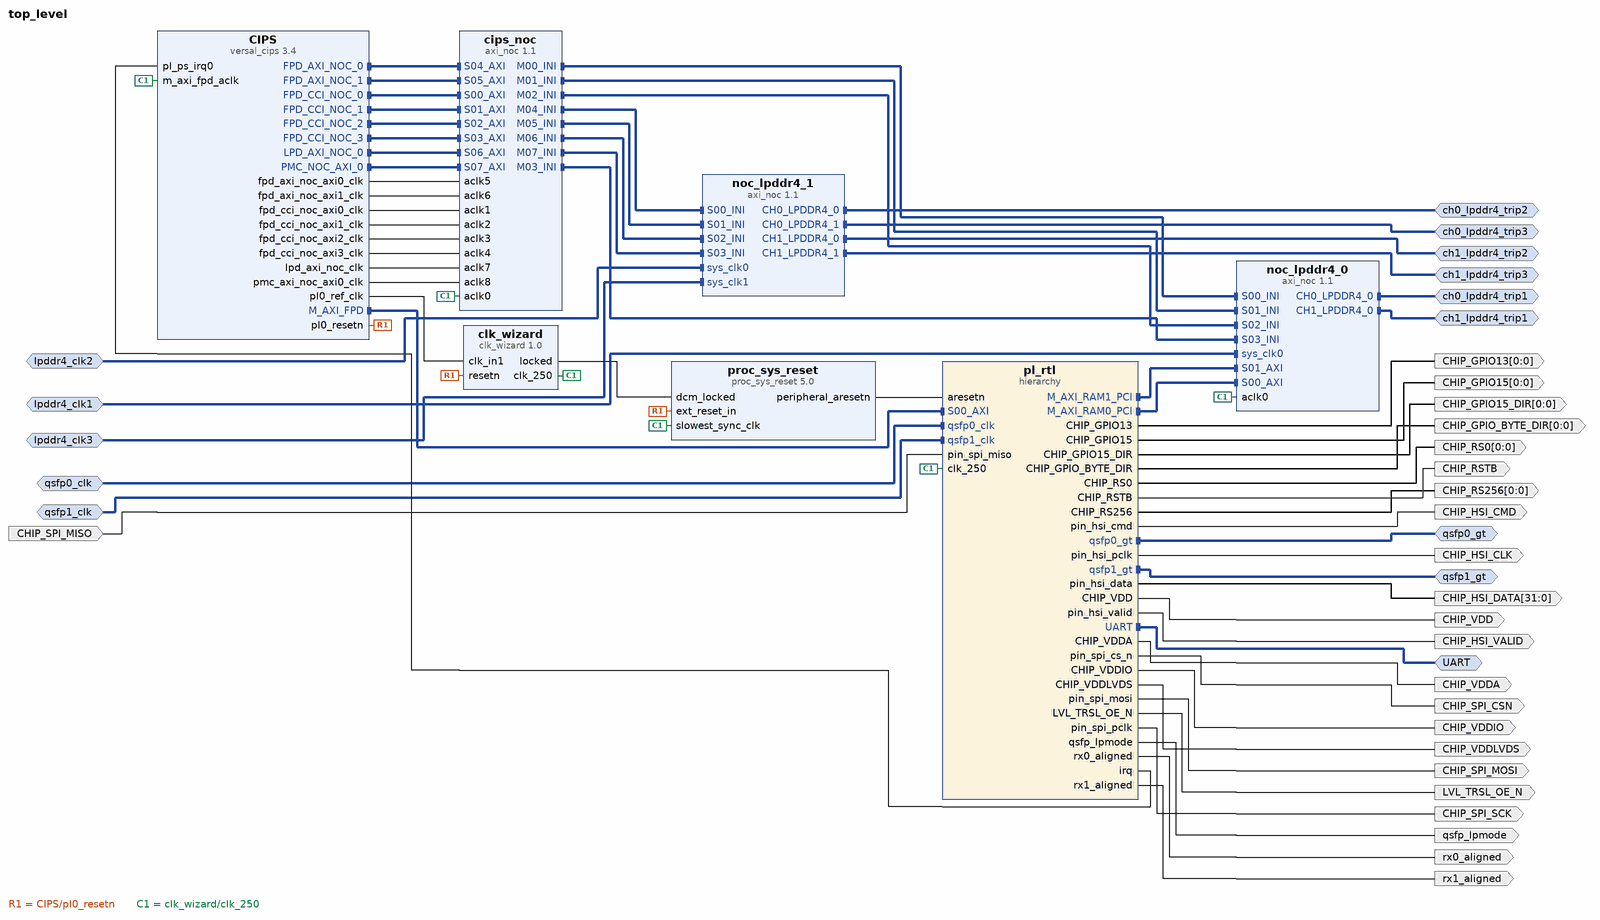
[diagram p0: block diagram of the top level]
# Vivado block design top_level, xcvp1202-vsva2785-2MP-e-S, Vivado 2024.2
create_bd_design top_level

create_bd_intf_port -mode Master -vlnv xilinx.com:interface:lpddr4_rtl:1.0 ch0_lpddr4_trip1
create_bd_intf_port -mode Master -vlnv xilinx.com:interface:lpddr4_rtl:1.0 ch0_lpddr4_trip2
create_bd_intf_port -mode Master -vlnv xilinx.com:interface:lpddr4_rtl:1.0 ch0_lpddr4_trip3
create_bd_intf_port -mode Master -vlnv xilinx.com:interface:lpddr4_rtl:1.0 ch1_lpddr4_trip1
create_bd_intf_port -mode Master -vlnv xilinx.com:interface:lpddr4_rtl:1.0 ch1_lpddr4_trip2
create_bd_intf_port -mode Master -vlnv xilinx.com:interface:lpddr4_rtl:1.0 ch1_lpddr4_trip3
create_bd_intf_port -mode Slave -vlnv xilinx.com:interface:diff_clock_rtl:1.0 lpddr4_clk1
set_property -dict {CONFIG.FREQ_HZ 200321000} [get_bd_intf_ports lpddr4_clk1]
create_bd_intf_port -mode Slave -vlnv xilinx.com:interface:diff_clock_rtl:1.0 lpddr4_clk2
set_property -dict {CONFIG.FREQ_HZ 200321000} [get_bd_intf_ports lpddr4_clk2]
create_bd_intf_port -mode Slave -vlnv xilinx.com:interface:diff_clock_rtl:1.0 lpddr4_clk3
set_property -dict {CONFIG.FREQ_HZ 200321000} [get_bd_intf_ports lpddr4_clk3]
create_bd_intf_port -mode Master -vlnv xilinx.com:interface:uart_rtl:1.0 UART
create_bd_intf_port -mode Slave -vlnv xilinx.com:interface:diff_clock_rtl:1.0 qsfp0_clk
set_property -dict {CONFIG.FREQ_HZ 156250000} [get_bd_intf_ports qsfp0_clk]
create_bd_intf_port -mode Slave -vlnv xilinx.com:interface:diff_clock_rtl:1.0 qsfp1_clk
set_property -dict {CONFIG.FREQ_HZ 156250000} [get_bd_intf_ports qsfp1_clk]
create_bd_intf_port -mode Master -vlnv xilinx.com:interface:gt_rtl:1.0 qsfp0_gt
create_bd_intf_port -mode Master -vlnv xilinx.com:interface:gt_rtl:1.0 qsfp1_gt
create_bd_port -dir O CHIP_SPI_CSN
create_bd_port -dir O CHIP_SPI_MOSI
create_bd_port -dir O CHIP_SPI_SCK
create_bd_port -dir I CHIP_SPI_MISO
create_bd_port -dir O CHIP_RSTB
create_bd_port -dir O LVL_TRSL_OE_N
create_bd_port -dir O CHIP_HSI_CLK
create_bd_port -dir O CHIP_VDDIO
create_bd_port -dir O CHIP_VDDLVDS
create_bd_port -dir O CHIP_VDD
create_bd_port -dir O CHIP_VDDA
create_bd_port -dir O -from 0 -to 0 CHIP_RS0
create_bd_port -dir O -from 0 -to 0 CHIP_RS256
create_bd_port -dir O -from 0 -to 0 CHIP_GPIO_BYTE_DIR
create_bd_port -dir O -from 0 -to 0 CHIP_GPIO15
create_bd_port -dir O -from 0 -to 0 CHIP_GPIO13
create_bd_port -dir O -from 0 -to 0 CHIP_GPIO15_DIR
create_bd_port -dir O CHIP_HSI_CMD
create_bd_port -dir O -from 31 -to 0 CHIP_HSI_DATA
create_bd_port -dir O CHIP_HSI_VALID
create_bd_port -dir O rx0_aligned
create_bd_port -dir O rx1_aligned
create_bd_port -dir O qsfp_lpmode

create_bd_cell -type ip -vlnv xilinx.com:ip:versal_cips:3.4 CIPS
set_property -dict [list \
  CONFIG.CLOCK_MODE Custom \
  CONFIG.DDR_MEMORY_MODE Custom \
  CONFIG.PS_BOARD_INTERFACE ps_pmc_fixed_io \
  CONFIG.PS_PL_CONNECTIVITY_MODE Custom \
  CONFIG.PS_PMC_CONFIG {['CLOCK_MODE Custom', 'DDR_MEMORY_MODE Custom', 'DESIGN_MODE 1', 'DEVICE_INTEGRITY_MODE {Sysmon temperature voltage and external IO monitoring}', 'PMC_CRP_PL0_REF_CTRL_FREQMHZ 99.999992', 'PMC_GPIO0_MIO_PERIPHERAL {{ENABLE 1} {IO {PMC_MIO 0 .. 25}}}', 'PMC_GPIO1_MIO_PERIPHERAL {{ENABLE 1} {IO {PMC_MIO 26 .. 51}}}', 'PMC_MIO37 {{AUX_IO 0} {DIRECTION out} {DRIVE_STRENGTH 8mA} {OUTPUT_DATA high} {PULL pullup} {SCHMITT 0} {SLEW slow} {USAGE GPIO}}', 'PMC_QSPI_FBCLK {{ENABLE 1} {IO {PMC_MIO 6}}}', 'PMC_QSPI_PERIPHERAL_DATA_MODE x4', 'PMC_QSPI_PERIPHERAL_ENABLE 1', 'PMC_QSPI_PERIPHERAL_MODE {Dual Parallel}', 'PMC_REF_CLK_FREQMHZ 33.3333', 'PMC_SD1 {{CD_ENABLE 1} {CD_IO {PMC_MIO 28}} {POW_ENABLE 1} {POW_IO {PMC_MIO 51}} {RESET_ENABLE 0} {RESET_IO {PMC_MIO 12}} {WP_ENABLE 0} {WP_IO {PMC_MIO 1}}}', 'PMC_SD1_PERIPHERAL {{CLK_100_SDR_OTAP_DLY 0x3} {CLK_200_SDR_OTAP_DLY 0x2} {CLK_50_DDR_ITAP_DLY 0x36} {CLK_50_DDR_OTAP_DLY 0x3} {CLK_50_SDR_ITAP_DLY 0x2C} {CLK_50_SDR_OTAP_DLY 0x4} {ENABLE 1} {IO {PMC_MIO 26 .. 36}}}', 'PMC_SD1_SLOT_TYPE {SD 3.0}', 'PMC_USE_PMC_NOC_AXI0 1', 'PS_BOARD_INTERFACE ps_pmc_fixed_io', 'PS_ENET0_MDIO {{ENABLE 1} {IO {PS_MIO 24 .. 25}}}', 'PS_ENET0_PERIPHERAL {{ENABLE 1} {IO {PS_MIO 0 .. 11}}}', 'PS_GEN_IPI0_ENABLE 1', 'PS_GEN_IPI0_MASTER A72', 'PS_GEN_IPI1_ENABLE 1', 'PS_GEN_IPI1_MASTER A72', 'PS_GEN_IPI2_ENABLE 1', 'PS_GEN_IPI2_MASTER A72', 'PS_GEN_IPI3_ENABLE 1', 'PS_GEN_IPI3_MASTER A72', 'PS_GEN_IPI4_ENABLE 1', 'PS_GEN_IPI4_MASTER A72', 'PS_GEN_IPI5_ENABLE 1', 'PS_GEN_IPI5_MASTER A72', 'PS_GEN_IPI6_ENABLE 1', 'PS_GEN_IPI6_MASTER A72', 'PS_I2C0_PERIPHERAL {{ENABLE 1} {IO {PMC_MIO 46 .. 47}}}', 'PS_I2C1_PERIPHERAL {{ENABLE 1} {IO {PMC_MIO 44 .. 45}}}', 'PS_I2CSYSMON_PERIPHERAL {{ENABLE 0} {IO {PMC_MIO 39 .. 40}}}', 'PS_IRQ_USAGE {{CH0 1} {CH1 0} {CH10 0} {CH11 0} {CH12 0} {CH13 0} {CH14 0} {CH15 0} {CH2 0} {CH3 0} {CH4 0} {CH5 0} {CH6 0} {CH7 0} {CH8 0} {CH9 0}}', 'PS_MIO7 {{AUX_IO 0} {DIRECTION in} {DRIVE_STRENGTH 8mA} {OUTPUT_DATA default} {PULL disable} {SCHMITT 0} {SLEW slow} {USAGE Reserved}}', 'PS_MIO9 {{AUX_IO 0} {DIRECTION in} {DRIVE_STRENGTH 8mA} {OUTPUT_DATA default} {PULL disable} {SCHMITT 0} {SLEW slow} {USAGE Reserved}}', 'PS_NUM_FABRIC_RESETS 1', 'PS_PCIE_EP_RESET1_IO {PS_MIO 18}', 'PS_PCIE_EP_RESET2_IO {PS_MIO 19}', 'PS_PCIE_RESET {ENABLE 1}', 'PS_PL_CONNECTIVITY_MODE Custom', 'PS_TTC0_PERIPHERAL_ENABLE 1', 'PS_UART0_PERIPHERAL {{ENABLE 1} {IO {PMC_MIO 42 .. 43}}}', 'PS_USB3_PERIPHERAL {{ENABLE 1} {IO {PMC_MIO 13 .. 25}}}', 'PS_USE_FPD_AXI_NOC0 1', 'PS_USE_FPD_AXI_NOC1 1', 'PS_USE_FPD_CCI_NOC 1', 'PS_USE_M_AXI_FPD 1', 'PS_USE_NOC_LPD_AXI0 1', 'PS_USE_PMCPL_CLK0 1', 'SMON_ALARMS Set_Alarms_On', 'SMON_ENABLE_TEMP_AVERAGING 0', 'SMON_INTERFACE_TO_USE I2C', 'SMON_MEAS36 {{ALARM_ENABLE 1} {ALARM_LOWER 0.00} {ALARM_UPPER 2.00} {AVERAGE_EN 0} {ENABLE 1} {MODE {2 V unipolar}} {NAME VCCAUX} {SUPPLY_NUM 0}}', 'SMON_MEAS37 {{ALARM_ENABLE 1} {ALARM_LOWER 0.00} {ALARM_UPPER 2.00} {AVERAGE_EN 0} {ENABLE 1} {MODE {2 V unipolar}} {NAME VCCAUX_PMC} {SUPPLY_NUM 1}}', 'SMON_MEAS58 {{ALARM_ENABLE 1} {ALARM_LOWER 0.00} {ALARM_UPPER 2.00} {AVERAGE_EN 0} {ENABLE 1} {MODE {2 V unipolar}} {NAME VCC_PMC} {SUPPLY_NUM 2}}', 'SMON_MEAS59 {{ALARM_ENABLE 1} {ALARM_LOWER 0.00} {ALARM_UPPER 2.00} {AVERAGE_EN 0} {ENABLE 1} {MODE {2 V unipolar}} {NAME VCC_PSFP} {SUPPLY_NUM 3}}', 'SMON_MEAS60 {{ALARM_ENABLE 1} {ALARM_LOWER 0.00} {ALARM_UPPER 2.00} {AVERAGE_EN 0} {ENABLE 1} {MODE {2 V unipolar}} {NAME VCC_PSLP} {SUPPLY_NUM 4}}', 'SMON_MEAS62 {{ALARM_ENABLE 1} {ALARM_LOWER 0.00} {ALARM_UPPER 2.00} {AVERAGE_EN 0} {ENABLE 1} {MODE {2 V unipolar}} {NAME VCC_SOC} {SUPPLY_NUM 5}}', 'SMON_MEAS63 {{ALARM_ENABLE 1} {ALARM_LOWER 0.00} {ALARM_UPPER 1.00} {AVERAGE_EN 0} {ENABLE 1} {MODE {2 V unipolar}} {NAME VP_VN} {SUPPLY_NUM 6}}', 'SMON_PMBUS_ADDRESS 0x18', 'SMON_TEMP_AVERAGING_SAMPLES 0']} \
] [get_bd_cells CIPS]
create_bd_cell -type hier pl_rtl
create_bd_cell -type ip -vlnv xilinx.com:ip:axi_noc:1.1 cips_noc
set_property -dict {CONFIG.NUM_CLKS 9 CONFIG.NUM_MI 0 CONFIG.NUM_NMI 8 CONFIG.NUM_NSI 0 CONFIG.NUM_SI 8} [get_bd_cells cips_noc]
create_bd_cell -type ip -vlnv xilinx.com:ip:clk_wizard:1.0 clk_wizard
set_property -dict [list \
  CONFIG.CLKOUT_DRIVES BUFG,BUFG,BUFG,BUFG,BUFG,BUFG,BUFG \
  CONFIG.CLKOUT_DYN_PS None,None,None,None,None,None,None \
  CONFIG.CLKOUT_GROUPING Auto,Auto,Auto,Auto,Auto,Auto,Auto \
  CONFIG.CLKOUT_MATCHED_ROUTING false,false,false,false,false,false,false \
  CONFIG.CLKOUT_PORT clk_250,clk_200,clk_out3,clk_out4,clk_out5,clk_out6,clk_out7 \
  CONFIG.CLKOUT_REQUESTED_DUTY_CYCLE 50.000,50.000,50.000,50.000,50.000,50.000,50.000 \
  CONFIG.CLKOUT_REQUESTED_OUT_FREQUENCY 250,200,300.000,100.000,100.000,100.000,100.000 \
  CONFIG.CLKOUT_REQUESTED_PHASE 0.000,0.000,0.000,0.000,0.000,0.000,0.000 \
  CONFIG.CLKOUT_USED true,false,false,false,false,false,false \
  CONFIG.JITTER_SEL Min_O_Jitter \
  CONFIG.PRIM_SOURCE No_buffer \
  CONFIG.RESET_TYPE ACTIVE_LOW \
  CONFIG.USE_LOCKED true \
  CONFIG.USE_PHASE_ALIGNMENT true \
  CONFIG.USE_RESET true \
] [get_bd_cells clk_wizard]
create_bd_cell -type ip -vlnv xilinx.com:ip:axi_noc:1.1 noc_lpddr4_0
set_property -dict [list \
  CONFIG.CH0_LPDDR4_0_BOARD_INTERFACE ch0_lpddr4_trip1 \
  CONFIG.CH1_LPDDR4_0_BOARD_INTERFACE ch1_lpddr4_trip1 \
  CONFIG.MC_CHANNEL_INTERLEAVING true \
  CONFIG.MC_CHAN_REGION1 DDR_LOW1 \
  CONFIG.MC_CH_INTERLEAVING_SIZE 4K_Bytes \
  CONFIG.NUM_MCP 4 \
  CONFIG.NUM_MI 0 \
  CONFIG.NUM_NSI 4 \
  CONFIG.NUM_SI 2 \
  CONFIG.sys_clk0_BOARD_INTERFACE lpddr4_clk1 \
] [get_bd_cells noc_lpddr4_0]
create_bd_cell -type ip -vlnv xilinx.com:ip:axi_noc:1.1 noc_lpddr4_1
set_property -dict [list \
  CONFIG.CH0_LPDDR4_0_BOARD_INTERFACE ch0_lpddr4_trip2 \
  CONFIG.CH0_LPDDR4_1_BOARD_INTERFACE ch0_lpddr4_trip3 \
  CONFIG.CH1_LPDDR4_0_BOARD_INTERFACE ch1_lpddr4_trip2 \
  CONFIG.CH1_LPDDR4_1_BOARD_INTERFACE ch1_lpddr4_trip3 \
  CONFIG.MC_CHAN_REGION0 DDR_CH1 \
  CONFIG.NUM_MCP 4 \
  CONFIG.NUM_MI 0 \
  CONFIG.NUM_NSI 4 \
  CONFIG.NUM_SI 0 \
  CONFIG.sys_clk0_BOARD_INTERFACE lpddr4_clk2 \
  CONFIG.sys_clk1_BOARD_INTERFACE lpddr4_clk3 \
] [get_bd_cells noc_lpddr4_1]
create_bd_cell -type ip -vlnv xilinx.com:ip:proc_sys_reset:5.0 proc_sys_reset

# ---- hierarchy /pl_rtl ----
current_bd_instance /pl_rtl
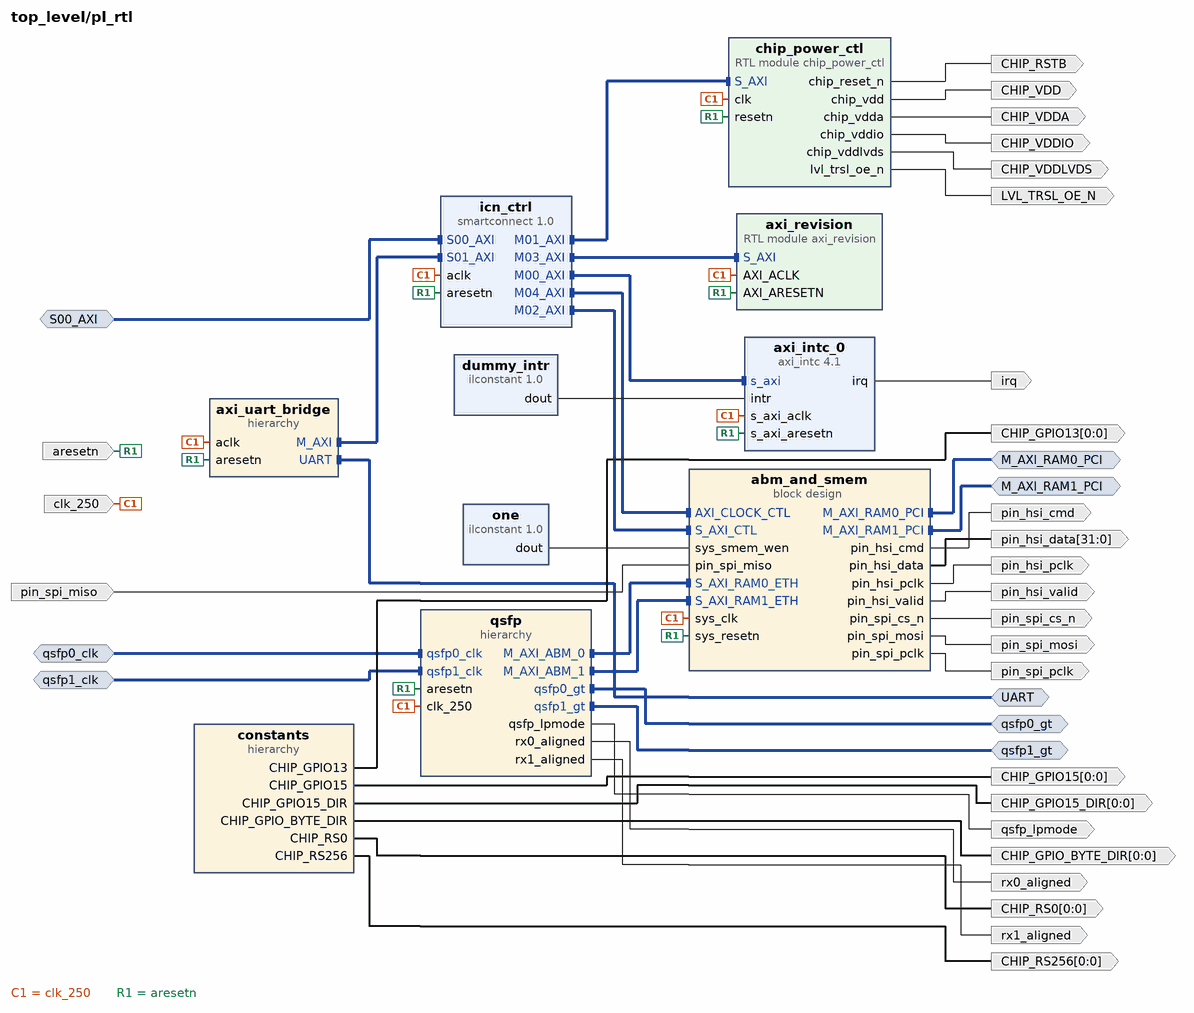
[diagram p1: block diagram inside /pl_rtl]
create_bd_intf_pin -mode Slave -vlnv xilinx.com:interface:aximm_rtl:1.0 S00_AXI
create_bd_intf_pin -mode Master -vlnv xilinx.com:interface:uart_rtl:1.0 UART
create_bd_intf_pin -mode Master -vlnv xilinx.com:interface:aximm_rtl:1.0 M_AXI_RAM1_PCI
create_bd_intf_pin -mode Master -vlnv xilinx.com:interface:aximm_rtl:1.0 M_AXI_RAM0_PCI
create_bd_intf_pin -mode Slave -vlnv xilinx.com:interface:diff_clock_rtl:1.0 qsfp0_clk
create_bd_intf_pin -mode Slave -vlnv xilinx.com:interface:diff_clock_rtl:1.0 qsfp1_clk
create_bd_intf_pin -mode Master -vlnv xilinx.com:interface:gt_rtl:1.0 qsfp0_gt
create_bd_intf_pin -mode Master -vlnv xilinx.com:interface:gt_rtl:1.0 qsfp1_gt
create_bd_pin -dir I -type clk clk_250
create_bd_pin -dir I -type rst aresetn
create_bd_pin -dir O -type intr irq
create_bd_pin -dir I pin_spi_miso
create_bd_pin -dir O pin_spi_cs_n
create_bd_pin -dir O pin_spi_mosi
create_bd_pin -dir O pin_hsi_cmd
create_bd_pin -dir O pin_hsi_valid
create_bd_pin -dir O pin_hsi_pclk
create_bd_pin -dir O -from 31 -to 0 pin_hsi_data
create_bd_pin -dir O pin_spi_pclk
create_bd_pin -dir O CHIP_RSTB
create_bd_pin -dir O LVL_TRSL_OE_N
create_bd_pin -dir O CHIP_VDDIO
create_bd_pin -dir O CHIP_VDD
create_bd_pin -dir O CHIP_VDDLVDS
create_bd_pin -dir O CHIP_VDDA
create_bd_pin -dir O -from 0 -to 0 CHIP_GPIO15_DIR
create_bd_pin -dir O -from 0 -to 0 CHIP_GPIO13
create_bd_pin -dir O -from 0 -to 0 CHIP_GPIO15
create_bd_pin -dir O -from 0 -to 0 CHIP_GPIO_BYTE_DIR
create_bd_pin -dir O -from 0 -to 0 CHIP_RS256
create_bd_pin -dir O -from 0 -to 0 CHIP_RS0
create_bd_pin -dir O rx0_aligned
create_bd_pin -dir O rx1_aligned
create_bd_pin -dir O qsfp_lpmode

create_bd_cell -type ip -vlnv xilinx.com:ip:smartconnect:1.0 icn_ctrl
set_property -dict {CONFIG.NUM_CLKS 1 CONFIG.NUM_MI 5 CONFIG.NUM_SI 2} [get_bd_cells icn_ctrl]
create_bd_cell -type hier axi_uart_bridge
create_bd_cell -type module -reference axi_revision axi_revision
create_bd_cell -type ip -vlnv xilinx.com:ip:axi_intc:4.1 axi_intc_0
set_property -dict {CONFIG.C_ASYNC_INTR 0xFFFFFFFF CONFIG.C_IRQ_CONNECTION 1} [get_bd_cells axi_intc_0]
create_bd_cell -type inline_hdl -vlnv xilinx.com:inline_hdl:ilconstant:1.0 dummy_intr
set_property -dict {CONFIG.CONST_VAL 0} [get_bd_cells dummy_intr]
create_bd_cell -type container -reference abm_and_smem abm_and_smem
set_property -dict [list \
  CONFIG.ACTIVE_SIM_BD abm_and_smem.bd \
  CONFIG.ACTIVE_SYNTH_BD abm_and_smem.bd \
  CONFIG.ENABLE_DFX 0 \
  CONFIG.LIST_SIM_BD abm_and_smem.bd \
  CONFIG.LIST_SYNTH_BD abm_and_smem.bd \
  CONFIG.LOCK_PROPAGATE 0 \
] [get_bd_cells abm_and_smem]
create_bd_cell -type inline_hdl -vlnv xilinx.com:inline_hdl:ilconstant:1.0 one
create_bd_cell -type module -reference chip_power_ctl chip_power_ctl
create_bd_cell -type hier constants
create_bd_cell -type hier qsfp

# ---- hierarchy /pl_rtl/axi_uart_bridge ----
current_bd_instance /pl_rtl/axi_uart_bridge
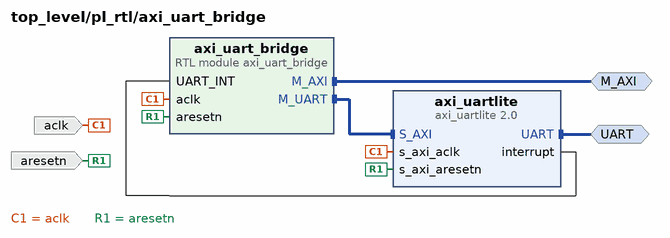
[diagram p2: block diagram inside /pl_rtl/axi_uart_bridge]
create_bd_intf_pin -mode Master -vlnv xilinx.com:interface:uart_rtl:1.0 UART
create_bd_intf_pin -mode Master -vlnv xilinx.com:interface:aximm_rtl:1.0 M_AXI
create_bd_pin -dir I aclk
create_bd_pin -dir I aresetn

create_bd_cell -type module -reference axi_uart_bridge axi_uart_bridge
create_bd_cell -type ip -vlnv xilinx.com:ip:axi_uartlite:2.0 axi_uartlite
set_property -dict {CONFIG.C_BAUDRATE 115200} [get_bd_cells axi_uartlite]

# ---- hierarchy /pl_rtl/constants ----
current_bd_instance /pl_rtl/constants
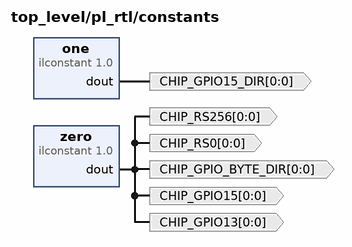
[diagram p3: block diagram inside /pl_rtl/constants]
create_bd_pin -dir O -from 0 -to 0 CHIP_GPIO15_DIR
create_bd_pin -dir O -from 0 -to 0 CHIP_GPIO13
create_bd_pin -dir O -from 0 -to 0 CHIP_GPIO15
create_bd_pin -dir O -from 0 -to 0 CHIP_GPIO_BYTE_DIR
create_bd_pin -dir O -from 0 -to 0 CHIP_RS256
create_bd_pin -dir O -from 0 -to 0 CHIP_RS0

create_bd_cell -type inline_hdl -vlnv xilinx.com:inline_hdl:ilconstant:1.0 one
create_bd_cell -type inline_hdl -vlnv xilinx.com:inline_hdl:ilconstant:1.0 zero
set_property -dict {CONFIG.CONST_VAL 0} [get_bd_cells zero]

# ---- hierarchy /pl_rtl/qsfp ----
current_bd_instance /pl_rtl/qsfp
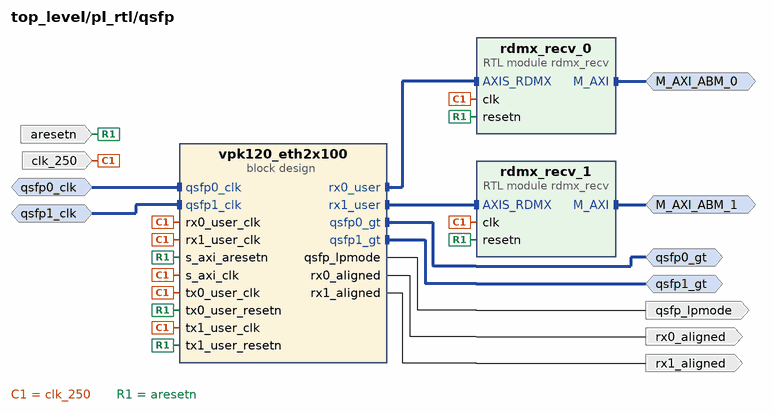
[diagram p4: block diagram inside /pl_rtl/qsfp]
create_bd_intf_pin -mode Master -vlnv xilinx.com:interface:gt_rtl:1.0 qsfp0_gt
create_bd_intf_pin -mode Master -vlnv xilinx.com:interface:gt_rtl:1.0 qsfp1_gt
create_bd_intf_pin -mode Slave -vlnv xilinx.com:interface:diff_clock_rtl:1.0 qsfp0_clk
create_bd_intf_pin -mode Slave -vlnv xilinx.com:interface:diff_clock_rtl:1.0 qsfp1_clk
create_bd_intf_pin -mode Master -vlnv xilinx.com:interface:aximm_rtl:1.0 M_AXI_ABM_0
create_bd_intf_pin -mode Master -vlnv xilinx.com:interface:aximm_rtl:1.0 M_AXI_ABM_1
create_bd_pin -dir I -type rst aresetn
create_bd_pin -dir I -type clk clk_250
create_bd_pin -dir O rx0_aligned
create_bd_pin -dir O rx1_aligned
create_bd_pin -dir O qsfp_lpmode

create_bd_cell -type container -reference vpk120_eth2x100 vpk120_eth2x100
set_property -dict [list \
  CONFIG.ACTIVE_SIM_BD vpk120_eth2x100.bd \
  CONFIG.ACTIVE_SYNTH_BD vpk120_eth2x100.bd \
  CONFIG.ENABLE_DFX 0 \
  CONFIG.LIST_SIM_BD vpk120_eth2x100.bd \
  CONFIG.LIST_SYNTH_BD vpk120_eth2x100.bd \
  CONFIG.LOCK_PROPAGATE 0 \
] [get_bd_cells vpk120_eth2x100]
create_bd_cell -type module -reference rdmx_recv rdmx_recv_0
create_bd_cell -type module -reference rdmx_recv rdmx_recv_1

# ---- connections ----

current_bd_instance /pl_rtl
connect_bd_intf_net [get_bd_intf_pins abm_and_smem/AXI_CLOCK_CTL] [get_bd_intf_pins icn_ctrl/M04_AXI]
connect_bd_intf_net -intf_net CIPS_0_M_AXI_GP0 [get_bd_intf_pins S00_AXI] [get_bd_intf_pins icn_ctrl/S00_AXI]
connect_bd_intf_net [get_bd_intf_pins qsfp/qsfp0_clk] [get_bd_intf_pins qsfp0_clk]
connect_bd_intf_net [get_bd_intf_pins qsfp/qsfp1_clk] [get_bd_intf_pins qsfp1_clk]
connect_bd_intf_net [get_bd_intf_pins qsfp/qsfp0_gt] [get_bd_intf_pins qsfp0_gt]
connect_bd_intf_net [get_bd_intf_pins qsfp/qsfp1_gt] [get_bd_intf_pins qsfp1_gt]
connect_bd_intf_net [get_bd_intf_pins abm_and_smem/S_AXI_CTL] [get_bd_intf_pins icn_ctrl/M02_AXI]
connect_bd_intf_net [get_bd_intf_pins M_AXI_RAM0_PCI] [get_bd_intf_pins abm_and_smem/M_AXI_RAM0_PCI]
connect_bd_intf_net [get_bd_intf_pins M_AXI_RAM1_PCI] [get_bd_intf_pins abm_and_smem/M_AXI_RAM1_PCI]
connect_bd_intf_net [get_bd_intf_pins axi_uart_bridge/M_AXI] [get_bd_intf_pins icn_ctrl/S01_AXI]
connect_bd_intf_net [get_bd_intf_pins UART] [get_bd_intf_pins axi_uart_bridge/UART]
connect_bd_intf_net [get_bd_intf_pins icn_ctrl/M00_AXI] [get_bd_intf_pins axi_intc_0/s_axi]
connect_bd_intf_net [get_bd_intf_pins chip_power_ctl/S_AXI] [get_bd_intf_pins icn_ctrl/M01_AXI]
connect_bd_intf_net [get_bd_intf_pins axi_revision/S_AXI] [get_bd_intf_pins icn_ctrl/M03_AXI]
connect_bd_intf_net [get_bd_intf_pins qsfp/M_AXI_ABM_0] [get_bd_intf_pins abm_and_smem/S_AXI_RAM0_ETH]
connect_bd_intf_net [get_bd_intf_pins qsfp/M_AXI_ABM_1] [get_bd_intf_pins abm_and_smem/S_AXI_RAM1_ETH]
connect_bd_net [get_bd_pins abm_and_smem/pin_hsi_cmd] [get_bd_pins pin_hsi_cmd]
connect_bd_net [get_bd_pins abm_and_smem/pin_hsi_data] [get_bd_pins pin_hsi_data]
connect_bd_net [get_bd_pins abm_and_smem/pin_hsi_pclk] [get_bd_pins pin_hsi_pclk]
connect_bd_net [get_bd_pins abm_and_smem/pin_hsi_valid] [get_bd_pins pin_hsi_valid]
connect_bd_net [get_bd_pins abm_and_smem/pin_spi_cs_n] [get_bd_pins pin_spi_cs_n]
connect_bd_net [get_bd_pins abm_and_smem/pin_spi_mosi] [get_bd_pins pin_spi_mosi]
connect_bd_net [get_bd_pins abm_and_smem/pin_spi_pclk] [get_bd_pins pin_spi_pclk]
connect_bd_net -net axi_intc_irq [get_bd_pins axi_intc_0/irq] [get_bd_pins irq]
connect_bd_net [get_bd_pins chip_power_ctl/chip_reset_n] [get_bd_pins CHIP_RSTB]
connect_bd_net [get_bd_pins chip_power_ctl/chip_vdd] [get_bd_pins CHIP_VDD]
connect_bd_net [get_bd_pins chip_power_ctl/chip_vdda] [get_bd_pins CHIP_VDDA]
connect_bd_net [get_bd_pins chip_power_ctl/chip_vddio] [get_bd_pins CHIP_VDDIO]
connect_bd_net [get_bd_pins chip_power_ctl/chip_vddlvds] [get_bd_pins CHIP_VDDLVDS]
connect_bd_net [get_bd_pins chip_power_ctl/lvl_trsl_oe_n] [get_bd_pins LVL_TRSL_OE_N]
connect_bd_net -net clk_wizard_0_clk_out1 [get_bd_pins clk_250] \
  [get_bd_pins icn_ctrl/aclk] [get_bd_pins axi_uart_bridge/aclk] [get_bd_pins axi_revision/AXI_ACLK] \
  [get_bd_pins axi_intc_0/s_axi_aclk] [get_bd_pins abm_and_smem/sys_clk] [get_bd_pins chip_power_ctl/clk] \
  [get_bd_pins qsfp/clk_250]
connect_bd_net [get_bd_pins constants/CHIP_GPIO13] [get_bd_pins CHIP_GPIO13]
connect_bd_net [get_bd_pins constants/CHIP_GPIO15] [get_bd_pins CHIP_GPIO15]
connect_bd_net [get_bd_pins constants/CHIP_GPIO15_DIR] [get_bd_pins CHIP_GPIO15_DIR]
connect_bd_net [get_bd_pins constants/CHIP_GPIO_BYTE_DIR] [get_bd_pins CHIP_GPIO_BYTE_DIR]
connect_bd_net [get_bd_pins constants/CHIP_RS0] [get_bd_pins CHIP_RS0]
connect_bd_net [get_bd_pins constants/CHIP_RS256] [get_bd_pins CHIP_RS256]
connect_bd_net [get_bd_pins dummy_intr/dout] [get_bd_pins axi_intc_0/intr]
connect_bd_net -net ilconstant_0_dout [get_bd_pins one/dout] [get_bd_pins abm_and_smem/sys_smem_wen]
connect_bd_net [get_bd_pins pin_spi_miso] [get_bd_pins abm_and_smem/pin_spi_miso]
connect_bd_net -net proc_sys_reset_0_peripheral_aresetn [get_bd_pins aresetn] \
  [get_bd_pins icn_ctrl/aresetn] [get_bd_pins axi_uart_bridge/aresetn] [get_bd_pins axi_revision/AXI_ARESETN] \
  [get_bd_pins axi_intc_0/s_axi_aresetn] [get_bd_pins abm_and_smem/sys_resetn] [get_bd_pins chip_power_ctl/resetn] \
  [get_bd_pins qsfp/aresetn]
connect_bd_net -net vpk120_eth2x100_0_qsfp_lpmode [get_bd_pins qsfp/qsfp_lpmode] [get_bd_pins qsfp_lpmode]
connect_bd_net -net vpk120_eth2x100_0_rx0_aligned [get_bd_pins qsfp/rx0_aligned] [get_bd_pins rx0_aligned]
connect_bd_net -net vpk120_eth2x100_0_rx1_aligned [get_bd_pins qsfp/rx1_aligned] [get_bd_pins rx1_aligned]

current_bd_instance /pl_rtl/axi_uart_bridge
connect_bd_intf_net [get_bd_intf_pins M_AXI] [get_bd_intf_pins axi_uart_bridge/M_AXI]
connect_bd_intf_net [get_bd_intf_pins axi_uartlite/S_AXI] [get_bd_intf_pins axi_uart_bridge/M_UART]
connect_bd_intf_net -intf_net axi_uartlite_0_UART [get_bd_intf_pins UART] [get_bd_intf_pins axi_uartlite/UART]
connect_bd_net [get_bd_pins aclk] [get_bd_pins axi_uart_bridge/aclk] [get_bd_pins axi_uartlite/s_axi_aclk]
connect_bd_net [get_bd_pins aresetn] [get_bd_pins axi_uart_bridge/aresetn] [get_bd_pins axi_uartlite/s_axi_aresetn]
connect_bd_net [get_bd_pins axi_uartlite/interrupt] [get_bd_pins axi_uart_bridge/UART_INT]

current_bd_instance /pl_rtl/constants
connect_bd_net [get_bd_pins one/dout] [get_bd_pins CHIP_GPIO15_DIR]
connect_bd_net [get_bd_pins zero/dout] \
  [get_bd_pins CHIP_GPIO13] [get_bd_pins CHIP_GPIO_BYTE_DIR] [get_bd_pins CHIP_GPIO15] [get_bd_pins CHIP_RS256] \
  [get_bd_pins CHIP_RS0]

current_bd_instance /pl_rtl/qsfp
connect_bd_intf_net [get_bd_intf_pins qsfp0_clk] [get_bd_intf_pins vpk120_eth2x100/qsfp0_clk]
connect_bd_intf_net [get_bd_intf_pins qsfp1_clk] [get_bd_intf_pins vpk120_eth2x100/qsfp1_clk]
connect_bd_intf_net [get_bd_intf_pins qsfp0_gt] [get_bd_intf_pins vpk120_eth2x100/qsfp0_gt]
connect_bd_intf_net [get_bd_intf_pins qsfp1_gt] [get_bd_intf_pins vpk120_eth2x100/qsfp1_gt]
connect_bd_intf_net [get_bd_intf_pins M_AXI_ABM_0] [get_bd_intf_pins rdmx_recv_0/M_AXI]
connect_bd_intf_net [get_bd_intf_pins M_AXI_ABM_1] [get_bd_intf_pins rdmx_recv_1/M_AXI]
connect_bd_intf_net -intf_net vpk120_eth2x100_0_rx0_user [get_bd_intf_pins rdmx_recv_0/AXIS_RDMX] [get_bd_intf_pins vpk120_eth2x100/rx0_user]
connect_bd_intf_net -intf_net vpk120_eth2x100_0_rx1_user [get_bd_intf_pins rdmx_recv_1/AXIS_RDMX] [get_bd_intf_pins vpk120_eth2x100/rx1_user]
connect_bd_net -net clk_wizard_0_clk_out1 [get_bd_pins clk_250] \
  [get_bd_pins vpk120_eth2x100/tx0_user_clk] [get_bd_pins vpk120_eth2x100/tx1_user_clk] \
  [get_bd_pins vpk120_eth2x100/rx1_user_clk] [get_bd_pins vpk120_eth2x100/rx0_user_clk] \
  [get_bd_pins vpk120_eth2x100/s_axi_clk] [get_bd_pins rdmx_recv_0/clk] [get_bd_pins rdmx_recv_1/clk]
connect_bd_net -net proc_sys_reset_0_peripheral_aresetn [get_bd_pins aresetn] \
  [get_bd_pins vpk120_eth2x100/tx0_user_resetn] [get_bd_pins vpk120_eth2x100/tx1_user_resetn] \
  [get_bd_pins vpk120_eth2x100/s_axi_aresetn] [get_bd_pins rdmx_recv_0/resetn] [get_bd_pins rdmx_recv_1/resetn]
connect_bd_net -net vpk120_eth2x100_0_qsfp_lpmode [get_bd_pins vpk120_eth2x100/qsfp_lpmode] [get_bd_pins qsfp_lpmode]
connect_bd_net -net vpk120_eth2x100_0_rx0_aligned [get_bd_pins vpk120_eth2x100/rx0_aligned] [get_bd_pins rx0_aligned]
connect_bd_net -net vpk120_eth2x100_0_rx1_aligned [get_bd_pins vpk120_eth2x100/rx1_aligned] [get_bd_pins rx1_aligned]

current_bd_instance /
connect_bd_intf_net -intf_net CIPS_0_FPD_AXI_NOC_0 [get_bd_intf_pins CIPS/FPD_AXI_NOC_0] [get_bd_intf_pins cips_noc/S04_AXI]
connect_bd_intf_net -intf_net CIPS_0_FPD_AXI_NOC_1 [get_bd_intf_pins CIPS/FPD_AXI_NOC_1] [get_bd_intf_pins cips_noc/S05_AXI]
connect_bd_intf_net -intf_net CIPS_0_FPD_CCI_NOC_0 [get_bd_intf_pins CIPS/FPD_CCI_NOC_0] [get_bd_intf_pins cips_noc/S00_AXI]
connect_bd_intf_net -intf_net CIPS_0_FPD_CCI_NOC_1 [get_bd_intf_pins CIPS/FPD_CCI_NOC_1] [get_bd_intf_pins cips_noc/S01_AXI]
connect_bd_intf_net -intf_net CIPS_0_FPD_CCI_NOC_2 [get_bd_intf_pins CIPS/FPD_CCI_NOC_2] [get_bd_intf_pins cips_noc/S02_AXI]
connect_bd_intf_net -intf_net CIPS_0_FPD_CCI_NOC_3 [get_bd_intf_pins CIPS/FPD_CCI_NOC_3] [get_bd_intf_pins cips_noc/S03_AXI]
connect_bd_intf_net -intf_net CIPS_0_LPD_AXI_NOC_0 [get_bd_intf_pins CIPS/LPD_AXI_NOC_0] [get_bd_intf_pins cips_noc/S06_AXI]
connect_bd_intf_net -intf_net CIPS_0_M_AXI_GP0 [get_bd_intf_pins CIPS/M_AXI_FPD] [get_bd_intf_pins pl_rtl/S00_AXI]
connect_bd_intf_net -intf_net CIPS_0_PMC_NOC_AXI_0 [get_bd_intf_pins CIPS/PMC_NOC_AXI_0] [get_bd_intf_pins cips_noc/S07_AXI]
connect_bd_intf_net [get_bd_intf_pins cips_noc/M00_INI] [get_bd_intf_pins noc_lpddr4_0/S00_INI]
connect_bd_intf_net [get_bd_intf_pins cips_noc/M01_INI] [get_bd_intf_pins noc_lpddr4_0/S01_INI]
connect_bd_intf_net [get_bd_intf_pins cips_noc/M02_INI] [get_bd_intf_pins noc_lpddr4_0/S02_INI]
connect_bd_intf_net [get_bd_intf_pins cips_noc/M03_INI] [get_bd_intf_pins noc_lpddr4_0/S03_INI]
connect_bd_intf_net [get_bd_intf_pins cips_noc/M04_INI] [get_bd_intf_pins noc_lpddr4_1/S00_INI]
connect_bd_intf_net [get_bd_intf_pins cips_noc/M05_INI] [get_bd_intf_pins noc_lpddr4_1/S01_INI]
connect_bd_intf_net [get_bd_intf_pins cips_noc/M06_INI] [get_bd_intf_pins noc_lpddr4_1/S02_INI]
connect_bd_intf_net [get_bd_intf_pins cips_noc/M07_INI] [get_bd_intf_pins noc_lpddr4_1/S03_INI]
connect_bd_intf_net -intf_net lpddr4_clk1_1 [get_bd_intf_ports lpddr4_clk1] [get_bd_intf_pins noc_lpddr4_0/sys_clk0]
connect_bd_intf_net -intf_net lpddr4_clk2_1 [get_bd_intf_ports lpddr4_clk2] [get_bd_intf_pins noc_lpddr4_1/sys_clk0]
connect_bd_intf_net -intf_net lpddr4_clk3_1 [get_bd_intf_ports lpddr4_clk3] [get_bd_intf_pins noc_lpddr4_1/sys_clk1]
connect_bd_intf_net [get_bd_intf_ports ch0_lpddr4_trip1] [get_bd_intf_pins noc_lpddr4_0/CH0_LPDDR4_0]
connect_bd_intf_net [get_bd_intf_ports ch1_lpddr4_trip1] [get_bd_intf_pins noc_lpddr4_0/CH1_LPDDR4_0]
connect_bd_intf_net [get_bd_intf_ports ch0_lpddr4_trip2] [get_bd_intf_pins noc_lpddr4_1/CH0_LPDDR4_0]
connect_bd_intf_net [get_bd_intf_ports ch0_lpddr4_trip3] [get_bd_intf_pins noc_lpddr4_1/CH0_LPDDR4_1]
connect_bd_intf_net [get_bd_intf_ports ch1_lpddr4_trip2] [get_bd_intf_pins noc_lpddr4_1/CH1_LPDDR4_0]
connect_bd_intf_net [get_bd_intf_ports ch1_lpddr4_trip3] [get_bd_intf_pins noc_lpddr4_1/CH1_LPDDR4_1]
connect_bd_intf_net [get_bd_intf_pins pl_rtl/M_AXI_RAM1_PCI] [get_bd_intf_pins noc_lpddr4_0/S01_AXI]
connect_bd_intf_net -intf_net pl_rtl_M_AXI_SYSRAM [get_bd_intf_pins pl_rtl/M_AXI_RAM0_PCI] [get_bd_intf_pins noc_lpddr4_0/S00_AXI]
connect_bd_intf_net [get_bd_intf_pins pl_rtl/UART] [get_bd_intf_ports UART]
connect_bd_intf_net [get_bd_intf_ports qsfp0_gt] [get_bd_intf_pins pl_rtl/qsfp0_gt]
connect_bd_intf_net [get_bd_intf_ports qsfp1_gt] [get_bd_intf_pins pl_rtl/qsfp1_gt]
connect_bd_intf_net -intf_net qsfp0_clk_0_1 [get_bd_intf_ports qsfp0_clk] [get_bd_intf_pins pl_rtl/qsfp0_clk]
connect_bd_intf_net -intf_net qsfp1_clk_0_1 [get_bd_intf_ports qsfp1_clk] [get_bd_intf_pins pl_rtl/qsfp1_clk]
connect_bd_net -net CIPS_0_fpd_axi_noc_axi0_clk [get_bd_pins CIPS/fpd_axi_noc_axi0_clk] [get_bd_pins cips_noc/aclk5]
connect_bd_net -net CIPS_0_fpd_axi_noc_axi1_clk [get_bd_pins CIPS/fpd_axi_noc_axi1_clk] [get_bd_pins cips_noc/aclk6]
connect_bd_net -net CIPS_0_fpd_cci_noc_axi0_clk [get_bd_pins CIPS/fpd_cci_noc_axi0_clk] [get_bd_pins cips_noc/aclk1]
connect_bd_net -net CIPS_0_fpd_cci_noc_axi1_clk [get_bd_pins CIPS/fpd_cci_noc_axi1_clk] [get_bd_pins cips_noc/aclk2]
connect_bd_net -net CIPS_0_fpd_cci_noc_axi2_clk [get_bd_pins CIPS/fpd_cci_noc_axi2_clk] [get_bd_pins cips_noc/aclk3]
connect_bd_net -net CIPS_0_fpd_cci_noc_axi3_clk [get_bd_pins CIPS/fpd_cci_noc_axi3_clk] [get_bd_pins cips_noc/aclk4]
connect_bd_net -net CIPS_0_lpd_axi_noc_clk [get_bd_pins CIPS/lpd_axi_noc_clk] [get_bd_pins cips_noc/aclk7]
connect_bd_net -net CIPS_0_pl_clk0 [get_bd_pins CIPS/pl0_ref_clk] [get_bd_pins clk_wizard/clk_in1]
connect_bd_net -net CIPS_0_pl_resetn1 [get_bd_pins CIPS/pl0_resetn] [get_bd_pins clk_wizard/resetn] [get_bd_pins proc_sys_reset/ext_reset_in]
connect_bd_net -net CIPS_0_pmc_axi_noc_axi0_clk [get_bd_pins CIPS/pmc_axi_noc_axi0_clk] [get_bd_pins cips_noc/aclk8]
connect_bd_net -net clk_wizard_0_clk_out1 [get_bd_pins clk_wizard/clk_250] \
  [get_bd_pins CIPS/m_axi_fpd_aclk] [get_bd_pins cips_noc/aclk0] [get_bd_pins proc_sys_reset/slowest_sync_clk] \
  [get_bd_pins pl_rtl/clk_250] [get_bd_pins noc_lpddr4_0/aclk0]
connect_bd_net -net clk_wizard_0_locked [get_bd_pins clk_wizard/locked] [get_bd_pins proc_sys_reset/dcm_locked]
connect_bd_net -net pin_spi_miso_1 [get_bd_ports CHIP_SPI_MISO] [get_bd_pins pl_rtl/pin_spi_miso]
connect_bd_net [get_bd_pins pl_rtl/CHIP_GPIO13] [get_bd_ports CHIP_GPIO13]
connect_bd_net [get_bd_pins pl_rtl/CHIP_GPIO15] [get_bd_ports CHIP_GPIO15]
connect_bd_net [get_bd_pins pl_rtl/CHIP_GPIO15_DIR] [get_bd_ports CHIP_GPIO15_DIR]
connect_bd_net [get_bd_pins pl_rtl/CHIP_GPIO_BYTE_DIR] [get_bd_ports CHIP_GPIO_BYTE_DIR]
connect_bd_net -net pl_rtl_CHIP_RESET_N [get_bd_pins pl_rtl/CHIP_RSTB] [get_bd_ports CHIP_RSTB]
connect_bd_net [get_bd_pins pl_rtl/CHIP_RS0] [get_bd_ports CHIP_RS0]
connect_bd_net [get_bd_pins pl_rtl/CHIP_RS256] [get_bd_ports CHIP_RS256]
connect_bd_net [get_bd_pins pl_rtl/CHIP_VDD] [get_bd_ports CHIP_VDD]
connect_bd_net [get_bd_pins pl_rtl/CHIP_VDDA] [get_bd_ports CHIP_VDDA]
connect_bd_net [get_bd_pins pl_rtl/CHIP_VDDIO] [get_bd_ports CHIP_VDDIO]
connect_bd_net [get_bd_pins pl_rtl/CHIP_VDDLVDS] [get_bd_ports CHIP_VDDLVDS]
connect_bd_net [get_bd_pins pl_rtl/LVL_TRSL_OE_N] [get_bd_ports LVL_TRSL_OE_N]
connect_bd_net [get_bd_pins pl_rtl/irq] [get_bd_pins CIPS/pl_ps_irq0]
connect_bd_net [get_bd_pins pl_rtl/pin_hsi_cmd] [get_bd_ports CHIP_HSI_CMD]
connect_bd_net [get_bd_pins pl_rtl/pin_hsi_data] [get_bd_ports CHIP_HSI_DATA]
connect_bd_net [get_bd_pins pl_rtl/pin_hsi_pclk] [get_bd_ports CHIP_HSI_CLK]
connect_bd_net [get_bd_pins pl_rtl/pin_hsi_valid] [get_bd_ports CHIP_HSI_VALID]
connect_bd_net [get_bd_pins pl_rtl/pin_spi_cs_n] [get_bd_ports CHIP_SPI_CSN]
connect_bd_net [get_bd_pins pl_rtl/pin_spi_mosi] [get_bd_ports CHIP_SPI_MOSI]
connect_bd_net [get_bd_pins pl_rtl/pin_spi_pclk] [get_bd_ports CHIP_SPI_SCK]
connect_bd_net [get_bd_pins pl_rtl/qsfp_lpmode] [get_bd_ports qsfp_lpmode]
connect_bd_net [get_bd_pins pl_rtl/rx0_aligned] [get_bd_ports rx0_aligned]
connect_bd_net [get_bd_pins pl_rtl/rx1_aligned] [get_bd_ports rx1_aligned]
connect_bd_net -net proc_sys_reset_0_peripheral_aresetn [get_bd_pins proc_sys_reset/peripheral_aresetn] [get_bd_pins pl_rtl/aresetn]
set_property PFM.CLOCK {clk_out1 {id "0" is_default "true" proc_sys_reset "/proc_sys_reset" status "fixed"}} [get_bd_cells clk_wizard]
set_property PFM.AXI_PORT {S02_AXI { memport "S_AXI_NOC" sptag "DDR" } S03_AXI { memport "S_AXI_NOC" sptag "DDR" } S04_AXI { memport "S_AXI_NOC" sptag "DDR" } S05_AXI { memport "S_AXI_NOC" sptag "DDR" } S06_AXI { memport "S_AXI_NOC" sptag "DDR" } S07_AXI { memport "S_AXI_NOC" sptag "DDR" } S08_AXI { memport "S_AXI_NOC" sptag "DDR" } S09_AXI { memport "S_AXI_NOC" sptag "DDR" } S10_AXI { memport "S_AXI_NOC" sptag "DDR" } S11_AXI { memport "S_AXI_NOC" sptag "DDR" } S12_AXI { memport "S_AXI_NOC" sptag "DDR" } S13_AXI { memport "S_AXI_NOC" sptag "DDR" } S14_AXI { memport "S_AXI_NOC" sptag "DDR" } S15_AXI { memport "S_AXI_NOC" sptag "DDR" } S16_AXI { memport "S_AXI_NOC" sptag "DDR" } S17_AXI { memport "S_AXI_NOC" sptag "DDR" } S18_AXI { memport "S_AXI_NOC" sptag "DDR" } S19_AXI { memport "S_AXI_NOC" sptag "DDR" } S20_AXI { memport "S_AXI_NOC" sptag "DDR" } S21_AXI { memport "S_AXI_NOC" sptag "DDR" } S22_AXI { memport "S_AXI_NOC" sptag "DDR" } S23_AXI { memport "S_AXI_NOC" sptag "DDR" } S24_AXI { memport "S_AXI_NOC" sptag "DDR" } S25_AXI { memport "S_AXI_NOC" sptag "DDR" } S26_AXI { memport "S_AXI_NOC" sptag "DDR" } S27_AXI { memport "S_AXI_NOC" sptag "DDR" } } [get_bd_cells noc_lpddr4_0]
set_property PFM.AXI_PORT {S00_AXI {memport "S_AXI_NOC" sptag "LPDDR"} S01_AXI {memport "S_AXI_NOC" sptag "LPDDR"} S02_AXI {memport "S_AXI_NOC" sptag "LPDDR"} S03_AXI {memport "S_AXI_NOC" sptag "LPDDR"} S04_AXI {memport "S_AXI_NOC" sptag "LPDDR"} S05_AXI {memport "S_AXI_NOC" sptag "LPDDR"} S06_AXI {memport "S_AXI_NOC" sptag "LPDDR"} S07_AXI {memport "S_AXI_NOC" sptag "LPDDR"} S08_AXI {memport "S_AXI_NOC" sptag "LPDDR"} S09_AXI {memport "S_AXI_NOC" sptag "LPDDR"} S10_AXI {memport "S_AXI_NOC" sptag "LPDDR"} S11_AXI {memport "S_AXI_NOC" sptag "LPDDR"} S12_AXI {memport "S_AXI_NOC" sptag "LPDDR"} S13_AXI {memport "S_AXI_NOC" sptag "LPDDR"} S14_AXI {memport "S_AXI_NOC" sptag "LPDDR"} S15_AXI {memport "S_AXI_NOC" sptag "LPDDR"} S16_AXI {memport "S_AXI_NOC" sptag "LPDDR"} S17_AXI {memport "S_AXI_NOC" sptag "LPDDR"} S18_AXI {memport "S_AXI_NOC" sptag "LPDDR"} S19_AXI {memport "S_AXI_NOC" sptag "LPDDR"} S20_AXI {memport "S_AXI_NOC" sptag "LPDDR"} S21_AXI {memport "S_AXI_NOC" sptag "LPDDR"} S22_AXI {memport "S_AXI_NOC" sptag "LPDDR"} S23_AXI {memport "S_AXI_NOC" sptag "LPDDR"} S24_AXI {memport "S_AXI_NOC" sptag "LPDDR"} S25_AXI {memport "S_AXI_NOC" sptag "LPDDR"} S26_AXI {memport "S_AXI_NOC" sptag "LPDDR"} S27_AXI {memport "S_AXI_NOC" sptag "LPDDR"}} [get_bd_cells noc_lpddr4_1]

# ---- address map ----
assign_bd_address -offset 0x0000000000000000 -range 2G -target_address_space [get_bd_addr_spaces CIPS/FPD_AXI_NOC_0] [get_bd_addr_segs noc_lpddr4_0/S00_INI/C0_DDR_LOW0]
assign_bd_address -offset 0x0000000800000000 -range 2G -target_address_space [get_bd_addr_spaces CIPS/FPD_AXI_NOC_0] [get_bd_addr_segs noc_lpddr4_0/S00_INI/C0_DDR_LOW1]
assign_bd_address -offset 0x0000000000000000 -range 2G -target_address_space [get_bd_addr_spaces CIPS/FPD_AXI_NOC_1] [get_bd_addr_segs noc_lpddr4_0/S00_INI/C0_DDR_LOW0]
assign_bd_address -offset 0x0000000800000000 -range 2G -target_address_space [get_bd_addr_spaces CIPS/FPD_AXI_NOC_1] [get_bd_addr_segs noc_lpddr4_0/S00_INI/C0_DDR_LOW1]
assign_bd_address -offset 0x0000000000000000 -range 2G -target_address_space [get_bd_addr_spaces CIPS/FPD_CCI_NOC_0] [get_bd_addr_segs noc_lpddr4_0/S00_INI/C0_DDR_LOW0]
assign_bd_address -offset 0x0000000800000000 -range 2G -target_address_space [get_bd_addr_spaces CIPS/FPD_CCI_NOC_0] [get_bd_addr_segs noc_lpddr4_0/S00_INI/C0_DDR_LOW1]
assign_bd_address -offset 0x0000050000000000 -range 8G -target_address_space [get_bd_addr_spaces CIPS/FPD_CCI_NOC_0] [get_bd_addr_segs noc_lpddr4_1/S00_INI/C0_DDR_CH1x2]
assign_bd_address -offset 0x0000000000000000 -range 2G -target_address_space [get_bd_addr_spaces CIPS/FPD_CCI_NOC_1] [get_bd_addr_segs noc_lpddr4_0/S01_INI/C1_DDR_LOW0]
assign_bd_address -offset 0x0000000800000000 -range 2G -target_address_space [get_bd_addr_spaces CIPS/FPD_CCI_NOC_1] [get_bd_addr_segs noc_lpddr4_0/S01_INI/C1_DDR_LOW1]
assign_bd_address -offset 0x0000050000000000 -range 8G -target_address_space [get_bd_addr_spaces CIPS/FPD_CCI_NOC_1] [get_bd_addr_segs noc_lpddr4_1/S01_INI/C1_DDR_CH1x2]
assign_bd_address -offset 0x0000000000000000 -range 2G -target_address_space [get_bd_addr_spaces CIPS/FPD_CCI_NOC_2] [get_bd_addr_segs noc_lpddr4_0/S02_INI/C2_DDR_LOW0]
assign_bd_address -offset 0x0000000800000000 -range 2G -target_address_space [get_bd_addr_spaces CIPS/FPD_CCI_NOC_2] [get_bd_addr_segs noc_lpddr4_0/S02_INI/C2_DDR_LOW1]
assign_bd_address -offset 0x0000050000000000 -range 8G -target_address_space [get_bd_addr_spaces CIPS/FPD_CCI_NOC_2] [get_bd_addr_segs noc_lpddr4_1/S02_INI/C2_DDR_CH1x2]
assign_bd_address -offset 0x0000000000000000 -range 2G -target_address_space [get_bd_addr_spaces CIPS/FPD_CCI_NOC_3] [get_bd_addr_segs noc_lpddr4_0/S03_INI/C3_DDR_LOW0]
assign_bd_address -offset 0x0000000800000000 -range 2G -target_address_space [get_bd_addr_spaces CIPS/FPD_CCI_NOC_3] [get_bd_addr_segs noc_lpddr4_0/S03_INI/C3_DDR_LOW1]
assign_bd_address -offset 0x0000050000000000 -range 8G -target_address_space [get_bd_addr_spaces CIPS/FPD_CCI_NOC_3] [get_bd_addr_segs noc_lpddr4_1/S03_INI/C3_DDR_CH1x2]
assign_bd_address -offset 0x0000000000000000 -range 2G -target_address_space [get_bd_addr_spaces CIPS/LPD_AXI_NOC_0] [get_bd_addr_segs noc_lpddr4_0/S00_INI/C0_DDR_LOW0]
assign_bd_address -offset 0x0000000800000000 -range 2G -target_address_space [get_bd_addr_spaces CIPS/LPD_AXI_NOC_0] [get_bd_addr_segs noc_lpddr4_0/S00_INI/C0_DDR_LOW1]
assign_bd_address -offset 0x000A4000000 -range 4K -target_address_space [get_bd_addr_spaces CIPS/M_AXI_FPD] [get_bd_addr_segs pl_rtl/axi_revision/S_AXI/reg0]
assign_bd_address -offset 0x000A4001000 -range 4K -target_address_space [get_bd_addr_spaces CIPS/M_AXI_FPD] [get_bd_addr_segs pl_rtl/abm_and_smem/abm_and_smem_ctl/S_AXI/reg0]
assign_bd_address -offset 0x000A4003000 -range 4K -target_address_space [get_bd_addr_spaces CIPS/M_AXI_FPD] [get_bd_addr_segs pl_rtl/abm_and_smem/chipif_cdc/clock_manager/clock_mgr_ctl/S_AXI/reg0]
assign_bd_address -offset 0x000A4004000 -range 4K -target_address_space [get_bd_addr_spaces CIPS/M_AXI_FPD] [get_bd_addr_segs pl_rtl/chip_power_ctl/S_AXI/reg0]
assign_bd_address -offset 0x000A4020000 -range 64K -target_address_space [get_bd_addr_spaces CIPS/M_AXI_FPD] [get_bd_addr_segs pl_rtl/axi_intc_0/S_AXI/Reg]
assign_bd_address -offset 0x0000000000000000 -range 2G -target_address_space [get_bd_addr_spaces CIPS/PMC_NOC_AXI_0] [get_bd_addr_segs noc_lpddr4_0/S00_INI/C0_DDR_LOW0]
assign_bd_address -offset 0x0000000800000000 -range 2G -target_address_space [get_bd_addr_spaces CIPS/PMC_NOC_AXI_0] [get_bd_addr_segs noc_lpddr4_0/S00_INI/C0_DDR_LOW1]
assign_bd_address -offset 0x0000050000000000 -range 8G -target_address_space [get_bd_addr_spaces CIPS/PMC_NOC_AXI_0] [get_bd_addr_segs noc_lpddr4_1/S00_INI/C0_DDR_CH1x2]
assign_bd_address -offset 0x0000000000000000 -range 1M -target_address_space [get_bd_addr_spaces pl_rtl/abm_and_smem/abm_manager/abm_loader_0/ABM_AXI] [get_bd_addr_segs pl_rtl/abm_and_smem/abm_manager/muxed_sdp_ram_if_0/S1_AXI/reg0]
assign_bd_address -offset 0x0000000000000000 -range 2G -target_address_space [get_bd_addr_spaces pl_rtl/abm_and_smem/abm_manager/abm_loader_0/PCI_AXI] [get_bd_addr_segs noc_lpddr4_0/S00_AXI/C0_DDR_LOW0]
assign_bd_address -offset 0x0000000800000000 -range 2G -target_address_space [get_bd_addr_spaces pl_rtl/abm_and_smem/abm_manager/abm_loader_0/PCI_AXI] [get_bd_addr_segs noc_lpddr4_0/S00_AXI/C0_DDR_LOW1]
assign_bd_address -offset 0x0000000000000000 -range 1M -target_address_space [get_bd_addr_spaces pl_rtl/abm_and_smem/abm_manager/abm_loader_1/ABM_AXI] [get_bd_addr_segs pl_rtl/abm_and_smem/abm_manager/muxed_sdp_ram_if_1/S1_AXI/reg0]
assign_bd_address -offset 0x0000000000000000 -range 2G -target_address_space [get_bd_addr_spaces pl_rtl/abm_and_smem/abm_manager/abm_loader_1/PCI_AXI] [get_bd_addr_segs noc_lpddr4_0/S01_AXI/C0_DDR_LOW0]
assign_bd_address -offset 0x0000000800000000 -range 2G -target_address_space [get_bd_addr_spaces pl_rtl/abm_and_smem/abm_manager/abm_loader_1/PCI_AXI] [get_bd_addr_segs noc_lpddr4_0/S01_AXI/C0_DDR_LOW1]
assign_bd_address -offset 0x000 -range 4K -target_address_space [get_bd_addr_spaces pl_rtl/abm_and_smem/chipif_cdc/clock_manager/clock_mgr/M_AXI] [get_bd_addr_segs pl_rtl/abm_and_smem/chipif_cdc/clock_manager/chipif_clock/s_axi_lite/Reg]
assign_bd_address -offset 0x00000 -range 1M -target_address_space [get_bd_addr_spaces pl_rtl/abm_and_smem/smem_writer/fetch_abm/M_ABM] [get_bd_addr_segs pl_rtl/abm_and_smem/abm_manager/abm_manager_if/S_AXI/reg0]
assign_bd_address -offset 0x00000 -range 1M -target_address_space [get_bd_addr_spaces pl_rtl/abm_and_smem/smem_writer/fetch_abm/M_SMC] [get_bd_addr_segs pl_rtl/abm_and_smem/smem_writer/cache/smem_cache_ctl/S_AXI/Mem0]
assign_bd_address -offset 0x00000000A4000000 -range 4K -target_address_space [get_bd_addr_spaces pl_rtl/axi_uart_bridge/axi_uart_bridge/M_AXI] [get_bd_addr_segs pl_rtl/axi_revision/S_AXI/reg0]
assign_bd_address -offset 0x00000000A4001000 -range 4K -target_address_space [get_bd_addr_spaces pl_rtl/axi_uart_bridge/axi_uart_bridge/M_AXI] [get_bd_addr_segs pl_rtl/abm_and_smem/abm_and_smem_ctl/S_AXI/reg0]
assign_bd_address -offset 0x00000000A4003000 -range 4K -target_address_space [get_bd_addr_spaces pl_rtl/axi_uart_bridge/axi_uart_bridge/M_AXI] [get_bd_addr_segs pl_rtl/abm_and_smem/chipif_cdc/clock_manager/clock_mgr_ctl/S_AXI/reg0]
assign_bd_address -offset 0x00000000A4004000 -range 4K -target_address_space [get_bd_addr_spaces pl_rtl/axi_uart_bridge/axi_uart_bridge/M_AXI] [get_bd_addr_segs pl_rtl/chip_power_ctl/S_AXI/reg0]
assign_bd_address -offset 0x00000000A4020000 -range 64K -target_address_space [get_bd_addr_spaces pl_rtl/axi_uart_bridge/axi_uart_bridge/M_AXI] [get_bd_addr_segs pl_rtl/axi_intc_0/S_AXI/Reg]
assign_bd_address -offset 0x40600000 -range 64K -target_address_space [get_bd_addr_spaces pl_rtl/axi_uart_bridge/axi_uart_bridge/M_UART] [get_bd_addr_segs pl_rtl/axi_uart_bridge/axi_uartlite/S_AXI/Reg]
assign_bd_address -offset 0x0000000000000000 -range 1M -target_address_space [get_bd_addr_spaces pl_rtl/qsfp/rdmx_recv_0/M_AXI] [get_bd_addr_segs pl_rtl/abm_and_smem/abm_manager/muxed_sdp_ram_if_0/S0_AXI/reg0]
assign_bd_address -offset 0x0000000000000000 -range 1M -target_address_space [get_bd_addr_spaces pl_rtl/qsfp/rdmx_recv_1/M_AXI] [get_bd_addr_segs pl_rtl/abm_and_smem/abm_manager/muxed_sdp_ram_if_1/S0_AXI/reg0]
assign_bd_address -offset 0xA4000000 -range 1M -target_address_space [get_bd_addr_spaces pl_rtl/qsfp/vpk120_eth2x100/dcmac_ctrl/M_AXI] [get_bd_addr_segs pl_rtl/qsfp/vpk120_eth2x100/dcmac_ip/dcmac_0/s_axi/Reg]
assign_bd_address -offset 0xA4000000 -range 1M -target_address_space [get_bd_addr_spaces pl_rtl/qsfp/vpk120_eth2x100/dcmac_iface/M_AXI] [get_bd_addr_segs pl_rtl/qsfp/vpk120_eth2x100/dcmac_ip/dcmac_0/s_axi/Reg]

validate_bd_design
save_bd_design
